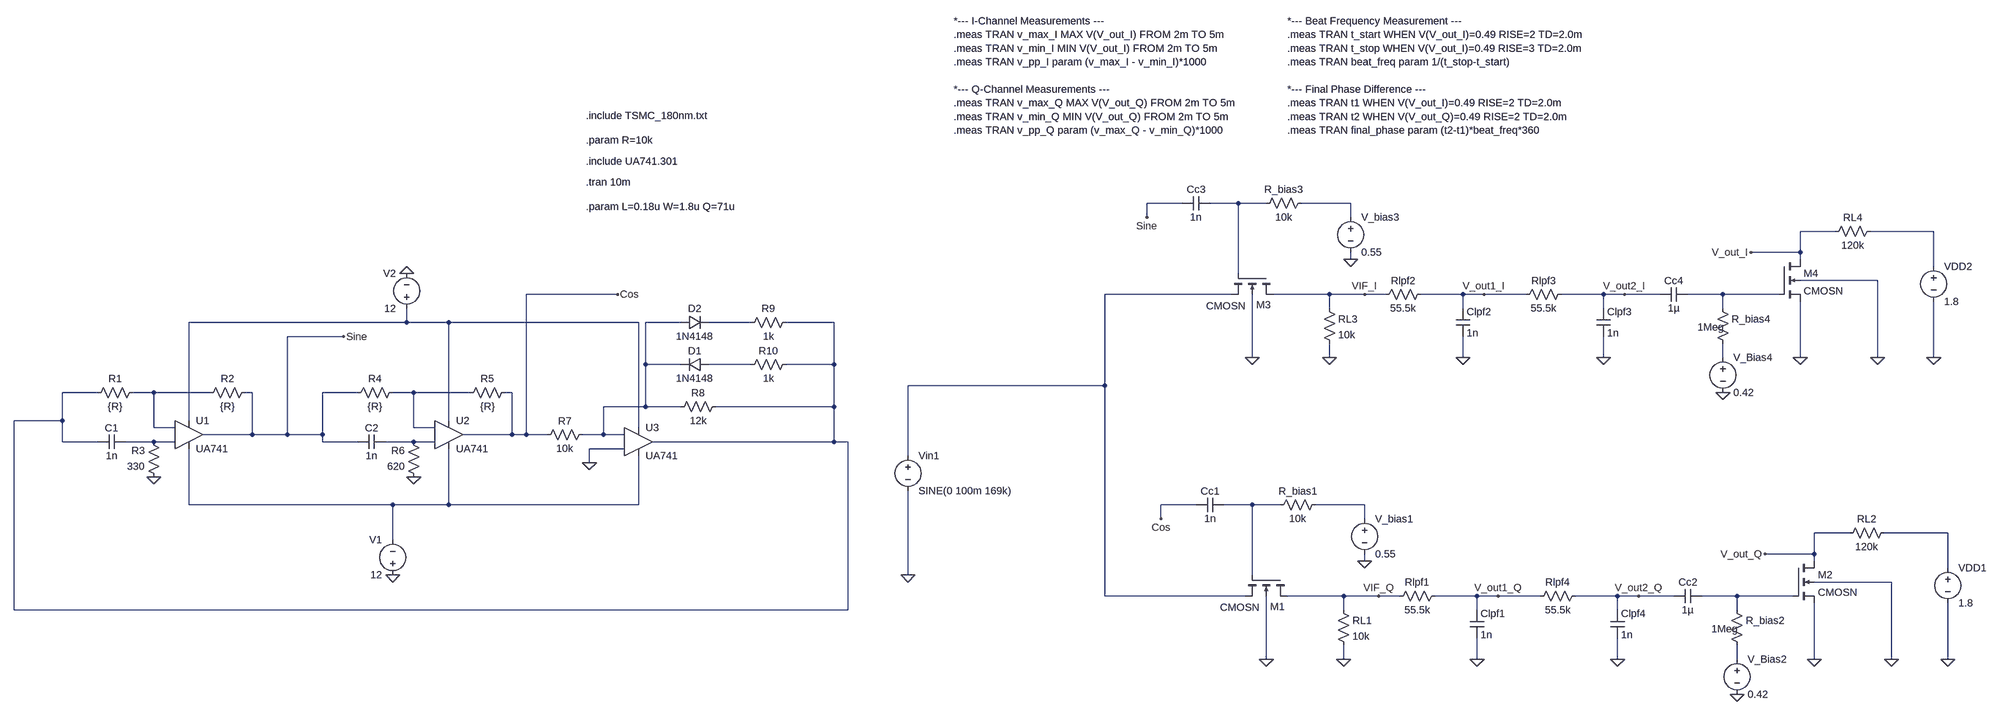
[diagram p0: schematic Final_Design.asc]
Final_Design.asc, the LTspice schematic file:
Version 4.1
SHEET 1 3356 1844
WIRE 1280 -496 1200 -496
WIRE 1408 -496 1344 -496
WIRE 1472 -496 1408 -496
WIRE 1664 -496 1552 -496
WIRE 1200 -464 1200 -496
WIRE 1664 -464 1664 -496
WIRE 2768 -432 2688 -432
WIRE 2992 -432 2848 -432
WIRE 2688 -384 2688 -432
WIRE 2688 -384 2576 -384
WIRE 1664 -368 1664 -384
WIRE 2688 -368 2688 -384
WIRE 2992 -352 2992 -432
WIRE 1408 -336 1408 -496
WIRE 2864 -320 2688 -320
WIRE -144 -288 -352 -288
WIRE 1392 -288 1104 -288
WIRE 1616 -288 1488 -288
WIRE 1696 -288 1616 -288
WIRE 1744 -288 1696 -288
WIRE 1920 -288 1824 -288
WIRE 1968 -288 1920 -288
WIRE 2064 -288 1968 -288
WIRE 2240 -288 2144 -288
WIRE 2288 -288 2240 -288
WIRE 2368 -288 2288 -288
WIRE 2512 -288 2432 -288
WIRE 2640 -288 2512 -288
WIRE 1616 -256 1616 -288
WIRE 1920 -256 1920 -288
WIRE 2240 -256 2240 -288
WIRE 2512 -256 2512 -288
WIRE -624 -224 -624 -256
WIRE -624 -224 -1120 -224
WIRE -528 -224 -624 -224
WIRE -96 -224 -528 -224
WIRE 0 -224 -80 -224
WIRE 160 -224 64 -224
WIRE 384 -224 240 -224
WIRE -768 -192 -896 -192
WIRE 1440 -144 1440 -288
WIRE 1616 -144 1616 -176
WIRE 1920 -144 1920 -192
WIRE 2240 -144 2240 -192
WIRE 2512 -144 2512 -176
WIRE 2688 -144 2688 -272
WIRE 2864 -144 2864 -320
WIRE 2992 -144 2992 -272
WIRE -80 -128 -80 -224
WIRE 0 -128 -80 -128
WIRE 160 -128 64 -128
WIRE 384 -128 384 -224
WIRE 384 -128 240 -128
WIRE 1104 -80 1104 -288
WIRE 1104 -80 656 -80
WIRE -1328 -64 -1408 -64
WIRE -1200 -64 -1248 -64
WIRE -1072 -64 -1200 -64
WIRE -976 -64 -992 -64
WIRE -736 -64 -816 -64
WIRE -608 -64 -656 -64
WIRE -480 -64 -608 -64
WIRE -384 -64 -400 -64
WIRE -80 -32 -80 -128
WIRE -80 -32 -176 -32
WIRE 0 -32 -80 -32
WIRE 384 -32 384 -128
WIRE 384 -32 80 -32
WIRE -1408 0 -1408 -64
WIRE -1408 0 -1600 0
WIRE -1120 0 -1120 -224
WIRE -528 0 -528 -224
WIRE -1200 16 -1200 -64
WIRE -1152 16 -1200 16
WIRE -608 16 -608 -64
WIRE -560 16 -608 16
WIRE -96 16 -96 -224
WIRE -976 32 -976 -64
WIRE -976 32 -1088 32
WIRE -896 32 -896 -192
WIRE -896 32 -976 32
WIRE -816 32 -816 -64
WIRE -816 32 -896 32
WIRE -384 32 -384 -64
WIRE -384 32 -496 32
WIRE -352 32 -352 -288
WIRE -352 32 -384 32
WIRE -304 32 -352 32
WIRE -176 32 -176 -32
WIRE -176 32 -224 32
WIRE -128 32 -176 32
WIRE -1408 48 -1408 0
WIRE -1328 48 -1408 48
WIRE -1200 48 -1264 48
WIRE -1152 48 -1200 48
WIRE -816 48 -816 32
WIRE -736 48 -816 48
WIRE -608 48 -672 48
WIRE -560 48 -608 48
WIRE 384 48 384 -32
WIRE 384 48 -64 48
WIRE 416 48 384 48
WIRE -128 64 -208 64
WIRE 656 80 656 -80
WIRE -208 96 -208 64
WIRE -1120 192 -1120 64
WIRE -656 192 -1120 192
WIRE -528 192 -528 64
WIRE -528 192 -656 192
WIRE -96 192 -96 80
WIRE -96 192 -528 192
WIRE 1312 192 1232 192
WIRE 1440 192 1376 192
WIRE 1504 192 1440 192
WIRE 1696 192 1584 192
WIRE 1232 224 1232 192
WIRE 1696 224 1696 192
WIRE 2800 256 2720 256
WIRE 3024 256 2880 256
WIRE -656 272 -656 192
WIRE 2720 304 2720 256
WIRE 2720 304 2608 304
WIRE 1696 320 1696 304
WIRE 2720 320 2720 304
WIRE 3024 336 3024 256
WIRE 656 352 656 160
WIRE 1440 352 1440 192
WIRE 2896 368 2720 368
WIRE 1104 400 1104 -80
WIRE 1424 400 1104 400
WIRE 1648 400 1520 400
WIRE 1728 400 1648 400
WIRE 1776 400 1728 400
WIRE 1952 400 1856 400
WIRE 2000 400 1952 400
WIRE 2096 400 2000 400
WIRE 2272 400 2176 400
WIRE 2320 400 2272 400
WIRE 2400 400 2320 400
WIRE 2544 400 2464 400
WIRE 2672 400 2544 400
WIRE -1600 432 -1600 0
WIRE 416 432 416 48
WIRE 416 432 -1600 432
WIRE 1648 432 1648 400
WIRE 1952 432 1952 400
WIRE 2272 432 2272 400
WIRE 2544 432 2544 400
WIRE 1472 544 1472 400
WIRE 1648 544 1648 512
WIRE 1952 544 1952 496
WIRE 2272 544 2272 496
WIRE 2544 544 2544 512
WIRE 2720 544 2720 416
WIRE 2896 544 2896 368
WIRE 3024 544 3024 416
FLAG 656 352 0
FLAG -1200 128 0
FLAG -608 128 0
FLAG -768 -192 Sine
FLAG -144 -288 Cos
FLAG -656 352 0
FLAG -624 -336 0
FLAG -208 96 0
FLAG 1472 544 0
FLAG 1648 544 0
FLAG 1696 320 0
FLAG 1728 400 VIF_Q
FLAG 1952 544 0
FLAG 2000 400 V_out1_Q
FLAG 2896 544 0
FLAG 2720 544 0
FLAG 3024 544 0
FLAG 2608 304 V_out_Q
FLAG 2544 624 0
FLAG 1440 -144 0
FLAG 1616 -144 0
FLAG 1664 -368 0
FLAG 1696 -288 VIF_I
FLAG 1920 -144 0
FLAG 1968 -288 V_out1_I
FLAG 2864 -144 0
FLAG 2688 -144 0
FLAG 2992 -144 0
FLAG 2576 -384 V_out_I
FLAG 2512 -64 0
FLAG 1200 -464 Sine
FLAG 1232 224 Cos
FLAG 2240 -144 0
FLAG 2288 -288 V_out2_I
FLAG 2272 544 0
FLAG 2320 400 V_out2_Q
SYMBOL voltage 656 64 R0
WINDOW 123 0 0 Left 0
WINDOW 39 0 0 Left 0
SYMATTR InstName Vin1
SYMATTR Value SINE(0 100m 169k)
SYMBOL UA741 -1120 -32 R0
SYMATTR InstName U1
SYMBOL res -1232 -80 R90
WINDOW 0 0 56 VBottom 2
WINDOW 3 32 56 VTop 2
SYMATTR InstName R1
SYMATTR Value {R}
SYMBOL res -976 -80 R90
WINDOW 0 0 56 VBottom 2
WINDOW 3 32 56 VTop 2
SYMATTR InstName R2
SYMATTR Value {R}
SYMBOL cap -1328 64 R270
WINDOW 0 32 32 VTop 2
WINDOW 3 0 32 VBottom 2
SYMATTR InstName C1
SYMATTR Value 1n
SYMBOL res -1184 144 R180
WINDOW 0 36 76 Left 2
WINDOW 3 36 40 Left 2
SYMATTR InstName R3
SYMATTR Value 330
SYMBOL UA741 -528 -32 R0
SYMATTR InstName U2
SYMBOL res -640 -80 R90
WINDOW 0 0 56 VBottom 2
WINDOW 3 32 56 VTop 2
SYMATTR InstName R4
SYMATTR Value {R}
SYMBOL res -384 -80 R90
WINDOW 0 0 56 VBottom 2
WINDOW 3 32 56 VTop 2
SYMATTR InstName R5
SYMATTR Value {R}
SYMBOL cap -736 64 R270
WINDOW 0 32 32 VTop 2
WINDOW 3 0 32 VBottom 2
SYMATTR InstName C2
SYMATTR Value 1n
SYMBOL res -592 144 R180
WINDOW 0 36 76 Left 2
WINDOW 3 36 40 Left 2
SYMATTR InstName R6
SYMATTR Value 620
SYMBOL UA741 -96 -16 R0
SYMATTR InstName U3
SYMBOL res -208 16 R90
WINDOW 0 0 56 VBottom 2
WINDOW 3 32 56 VTop 2
SYMATTR InstName R7
SYMATTR Value 10k
SYMBOL voltage -656 368 R180
WINDOW 0 24 96 Left 2
WINDOW 3 24 16 Left 2
SYMATTR InstName V1
SYMATTR Value 12
SYMBOL voltage -624 -240 R180
WINDOW 0 24 96 Left 2
WINDOW 3 24 16 Left 2
SYMATTR InstName V2
SYMATTR Value 12
SYMBOL res 96 -48 R90
WINDOW 0 0 56 VBottom 2
WINDOW 3 32 56 VTop 2
SYMATTR InstName R8
SYMATTR Value 12k
SYMBOL diode 64 -144 R90
WINDOW 0 0 32 VBottom 2
WINDOW 3 32 32 VTop 2
SYMATTR InstName D1
SYMATTR Value 1N4148
SYMBOL diode 0 -208 R270
WINDOW 0 32 32 VTop 2
WINDOW 3 0 32 VBottom 2
SYMATTR InstName D2
SYMATTR Value 1N4148
SYMBOL res 256 -240 R90
WINDOW 0 0 56 VBottom 2
WINDOW 3 32 56 VTop 2
SYMATTR InstName R9
SYMATTR Value 1k
SYMBOL res 256 -144 R90
WINDOW 0 0 56 VBottom 2
WINDOW 3 32 56 VTop 2
SYMATTR InstName R10
SYMATTR Value 1k
SYMBOL nmos4 1520 352 R90
WINDOW 0 72 5 VRight 2
WINDOW 3 74 64 VRight 2
SYMATTR InstName M1
SYMATTR Value CMOSN
SYMATTR Value2 l=L w=W ad=5*L*W/2 as=5*L*W/2 pd=5*L+2*W ps=5*L+2*W
SYMBOL res 1632 416 R0
SYMATTR InstName RL1
SYMATTR Value 10k
SYMBOL res 1600 176 R90
WINDOW 0 0 56 VBottom 2
WINDOW 3 32 56 VTop 2
SYMATTR InstName R_bias1
SYMATTR Value 10k
SYMBOL voltage 1696 208 R0
SYMATTR InstName V_bias1
SYMATTR Value 0.55
SYMBOL cap 1376 176 R90
WINDOW 0 0 32 VBottom 2
WINDOW 3 32 32 VTop 2
SYMATTR InstName Cc1
SYMATTR Value 1n
SYMBOL res 1872 384 R90
WINDOW 0 0 56 VBottom 2
WINDOW 3 32 56 VTop 2
SYMATTR InstName Rlpf1
SYMATTR Value 55.5k
SYMBOL cap 1936 432 R0
SYMATTR InstName Clpf1
SYMATTR Value 1n
SYMBOL nmos4 2672 320 R0
SYMATTR InstName M2
SYMATTR Value CMOSN
SYMATTR Value2 l=L w=Q ad=5*L*Q/2 as=5*L*Q/2 pd=5*L+2*Q ps=5*L+2*Q
SYMBOL res 2896 240 R90
WINDOW 0 0 56 VBottom 2
WINDOW 3 32 56 VTop 2
SYMATTR InstName RL2
SYMATTR Value 120k
SYMBOL voltage 3024 320 R0
WINDOW 123 0 0 Left 0
WINDOW 39 0 0 Left 0
SYMATTR InstName VDD1
SYMATTR Value 1.8
SYMBOL cap 2464 384 R90
WINDOW 0 0 32 VBottom 2
WINDOW 3 32 32 VTop 2
SYMATTR InstName Cc2
SYMATTR Value 1µ
SYMBOL res 2528 416 R0
WINDOW 3 -42 59 Left 2
SYMATTR Value 1Meg
SYMATTR InstName R_bias2
SYMBOL voltage 2544 528 R0
SYMATTR InstName V_Bias2
SYMATTR Value 0.42
SYMBOL nmos4 1488 -336 R90
WINDOW 0 72 5 VRight 2
WINDOW 3 74 64 VRight 2
SYMATTR InstName M3
SYMATTR Value CMOSN
SYMATTR Value2 l=L w=W ad=5*L*W/2 as=5*L*W/2 pd=5*L+2*W ps=5*L+2*W
SYMBOL res 1600 -272 R0
SYMATTR InstName RL3
SYMATTR Value 10k
SYMBOL res 1568 -512 R90
WINDOW 0 0 56 VBottom 2
WINDOW 3 32 56 VTop 2
SYMATTR InstName R_bias3
SYMATTR Value 10k
SYMBOL voltage 1664 -480 R0
SYMATTR InstName V_bias3
SYMATTR Value 0.55
SYMBOL cap 1344 -512 R90
WINDOW 0 0 32 VBottom 2
WINDOW 3 32 32 VTop 2
SYMATTR InstName Cc3
SYMATTR Value 1n
SYMBOL res 1840 -304 R90
WINDOW 0 0 56 VBottom 2
WINDOW 3 32 56 VTop 2
SYMATTR InstName Rlpf2
SYMATTR Value 55.5k
SYMBOL cap 1904 -256 R0
SYMATTR InstName Clpf2
SYMATTR Value 1n
SYMBOL nmos4 2640 -368 R0
SYMATTR InstName M4
SYMATTR Value CMOSN
SYMATTR Value2 l=L w=Q ad=5*L*Q/2 as=5*L*Q/2 pd=5*L+2*Q ps=5*L+2*Q
SYMBOL res 2864 -448 R90
WINDOW 0 0 56 VBottom 2
WINDOW 3 32 56 VTop 2
SYMATTR InstName RL4
SYMATTR Value 120k
SYMBOL voltage 2992 -368 R0
WINDOW 123 0 0 Left 0
WINDOW 39 0 0 Left 0
SYMATTR InstName VDD2
SYMATTR Value 1.8
SYMBOL cap 2432 -304 R90
WINDOW 0 0 32 VBottom 2
WINDOW 3 32 32 VTop 2
SYMATTR InstName Cc4
SYMATTR Value 1µ
SYMBOL res 2496 -272 R0
WINDOW 3 -42 59 Left 2
SYMATTR Value 1Meg
SYMATTR InstName R_bias4
SYMBOL voltage 2512 -160 R0
SYMATTR InstName V_Bias4
SYMATTR Value 0.42
SYMBOL res 2160 -304 R90
WINDOW 0 0 56 VBottom 2
WINDOW 3 32 56 VTop 2
SYMATTR InstName Rlpf3
SYMATTR Value 55.5k
SYMBOL cap 2224 -256 R0
SYMATTR InstName Clpf3
SYMATTR Value 1n
SYMBOL res 2192 384 R90
WINDOW 0 0 56 VBottom 2
WINDOW 3 32 56 VTop 2
SYMATTR InstName Rlpf4
SYMATTR Value 55.5k
SYMBOL cap 2256 432 R0
SYMATTR InstName Clpf4
SYMATTR Value 1n
TEXT -216 -544 Left 2 !.tran 10m
TEXT -216 -592 Left 2 !.include UA741.301
TEXT -216 -640 Left 2 !.param R=10k
TEXT -216 -696 Left 2 !.include TSMC_180nm.txt
TEXT -216 -488 Left 2 !.param L=0.18u W=1.8u Q=71u
TEXT 760 -912 Left 2 !*--- I-Channel Measurements ---\n.meas TRAN v_max_I MAX V(V_out_I) FROM 2m TO 5m\n.meas TRAN v_min_I MIN V(V_out_I) FROM 2m TO 5m\n.meas TRAN v_pp_I param (v_max_I - v_min_I)*1000\n \n*--- Q-Channel Measurements ---\n.meas TRAN v_max_Q MAX V(V_out_Q) FROM 2m TO 5m\n.meas TRAN v_min_Q MIN V(V_out_Q) FROM 2m TO 5m\n.meas TRAN v_pp_Q param (v_max_Q - v_min_Q)*1000
TEXT 1520 -912 Left 2 !*--- Beat Frequency Measurement ---\n.meas TRAN t_start WHEN V(V_out_I)=0.49 RISE=2 TD=2.0m\n.meas TRAN t_stop WHEN V(V_out_I)=0.49 RISE=3 TD=2.0m\n.meas TRAN beat_freq param 1/(t_stop-t_start)\n \n*--- Final Phase Difference ---\n.meas TRAN t1 WHEN V(V_out_I)=0.49 RISE=2 TD=2.0m\n.meas TRAN t2 WHEN V(V_out_Q)=0.49 RISE=2 TD=2.0m\n.meas TRAN final_phase param (t2-t1)*beat_freq*360

The netlist it stands for:
* Final_Design.asc
Vin1 N004 0 SINE(0 100m 169k)
X§U1 N014 N012 N006 N016 Sine UA741  ; pins In+ In- V+ V- OUT
R1 N012 N009 {R}
R2 Sine N012 {R}
C1 N009 N014 1n
R3 0 N014 330
X§U2 N015 N013 N006 N016 Cos UA741  ; pins In+ In- V+ V- OUT
R4 N013 Sine {R}
R5 Cos N013 {R}
C2 Sine N015 1n
R6 0 N015 620
X§U3 0 N007 N006 N016 N009 UA741  ; pins In+ In- V+ V- OUT
R7 N007 Cos 10k
V1 0 N016 12
V2 N006 0 12
R8 N009 N007 12k
D1 N011 N007 1N4148
D2 N007 N008 1N4148
R9 N009 N008 1k
R10 N009 N011 1k
M1 VIF_Q N017 N004 0 CMOSN l=L w=W ad=5*L*W/2 as=5*L*W/2 pd=5*L+2*W ps=5*L+2*W
RL1 VIF_Q 0 10k
R_bias1 N018 N017 10k
V_bias1 N018 0 0.55
Cc1 N017 Cos 1n
Rlpf1 V_out1_Q VIF_Q 55.5k
Clpf1 V_out1_Q 0 1n
M2 V_out_Q N020 0 0 CMOSN l=L w=Q ad=5*L*Q/2 as=5*L*Q/2 pd=5*L+2*Q ps=5*L+2*Q
RL2 N019 V_out_Q 120k
VDD1 N019 0 1.8
Cc2 N020 V_out2_Q 1µ
R_bias2 N020 N021 1Meg
V_Bias2 N021 0 0.42
M3 VIF_I N001 N004 0 CMOSN l=L w=W ad=5*L*W/2 as=5*L*W/2 pd=5*L+2*W ps=5*L+2*W
RL3 VIF_I 0 10k
R_bias3 N002 N001 10k
V_bias3 N002 0 0.55
Cc3 N001 Sine 1n
Rlpf2 V_out1_I VIF_I 55.5k
Clpf2 V_out1_I 0 1n
M4 V_out_I N005 0 0 CMOSN l=L w=Q ad=5*L*Q/2 as=5*L*Q/2 pd=5*L+2*Q ps=5*L+2*Q
RL4 N003 V_out_I 120k
VDD2 N003 0 1.8
Cc4 N005 V_out2_I 1µ
R_bias4 N005 N010 1Meg
V_Bias4 N010 0 0.42
Rlpf3 V_out2_I V_out1_I 55.5k
Clpf3 V_out2_I 0 1n
Rlpf4 V_out2_Q V_out1_Q 55.5k
Clpf4 V_out2_Q 0 1n
.model D D
.lib standard.dio
.model NMOS NMOS
.model PMOS PMOS
.lib standard.mos
.tran 10m
.include UA741.301
.param R=10k
.include TSMC_180nm.txt
.param L=0.18u W=1.8u Q=71u
*--- I-Channel Measurements ---
.meas TRAN v_max_I MAX V(V_out_I) FROM 2m TO 5m
.meas TRAN v_min_I MIN V(V_out_I) FROM 2m TO 5m
.meas TRAN v_pp_I param (v_max_I - v_min_I)*1000
*--- Q-Channel Measurements ---
.meas TRAN v_max_Q MAX V(V_out_Q) FROM 2m TO 5m
.meas TRAN v_min_Q MIN V(V_out_Q) FROM 2m TO 5m
.meas TRAN v_pp_Q param (v_max_Q - v_min_Q)*1000
*--- Beat Frequency Measurement ---
.meas TRAN t_start WHEN V(V_out_I)=0.49 RISE=2 TD=2.0m
.meas TRAN t_stop WHEN V(V_out_I)=0.49 RISE=3 TD=2.0m
.meas TRAN beat_freq param 1/(t_stop-t_start)
*--- Final Phase Difference ---
.meas TRAN t1 WHEN V(V_out_I)=0.49 RISE=2 TD=2.0m
.meas TRAN t2 WHEN V(V_out_Q)=0.49 RISE=2 TD=2.0m
.meas TRAN final_phase param (t2-t1)*beat_freq*360
.backanno
.end